# EasyEDA Pro project ESP32S3_DMX_RDM_2026-06-09.epro, schematic Schematic1
Create Date: 2026-09-02; Page Name: P1; Project Name: ESP32S3_DMX_RDM_2026-06-09; Schematic Name: Schematic1; Update Date: 2026-09-02; Company: 嘉立创EDA; Page Size: A3; Version: V1.0
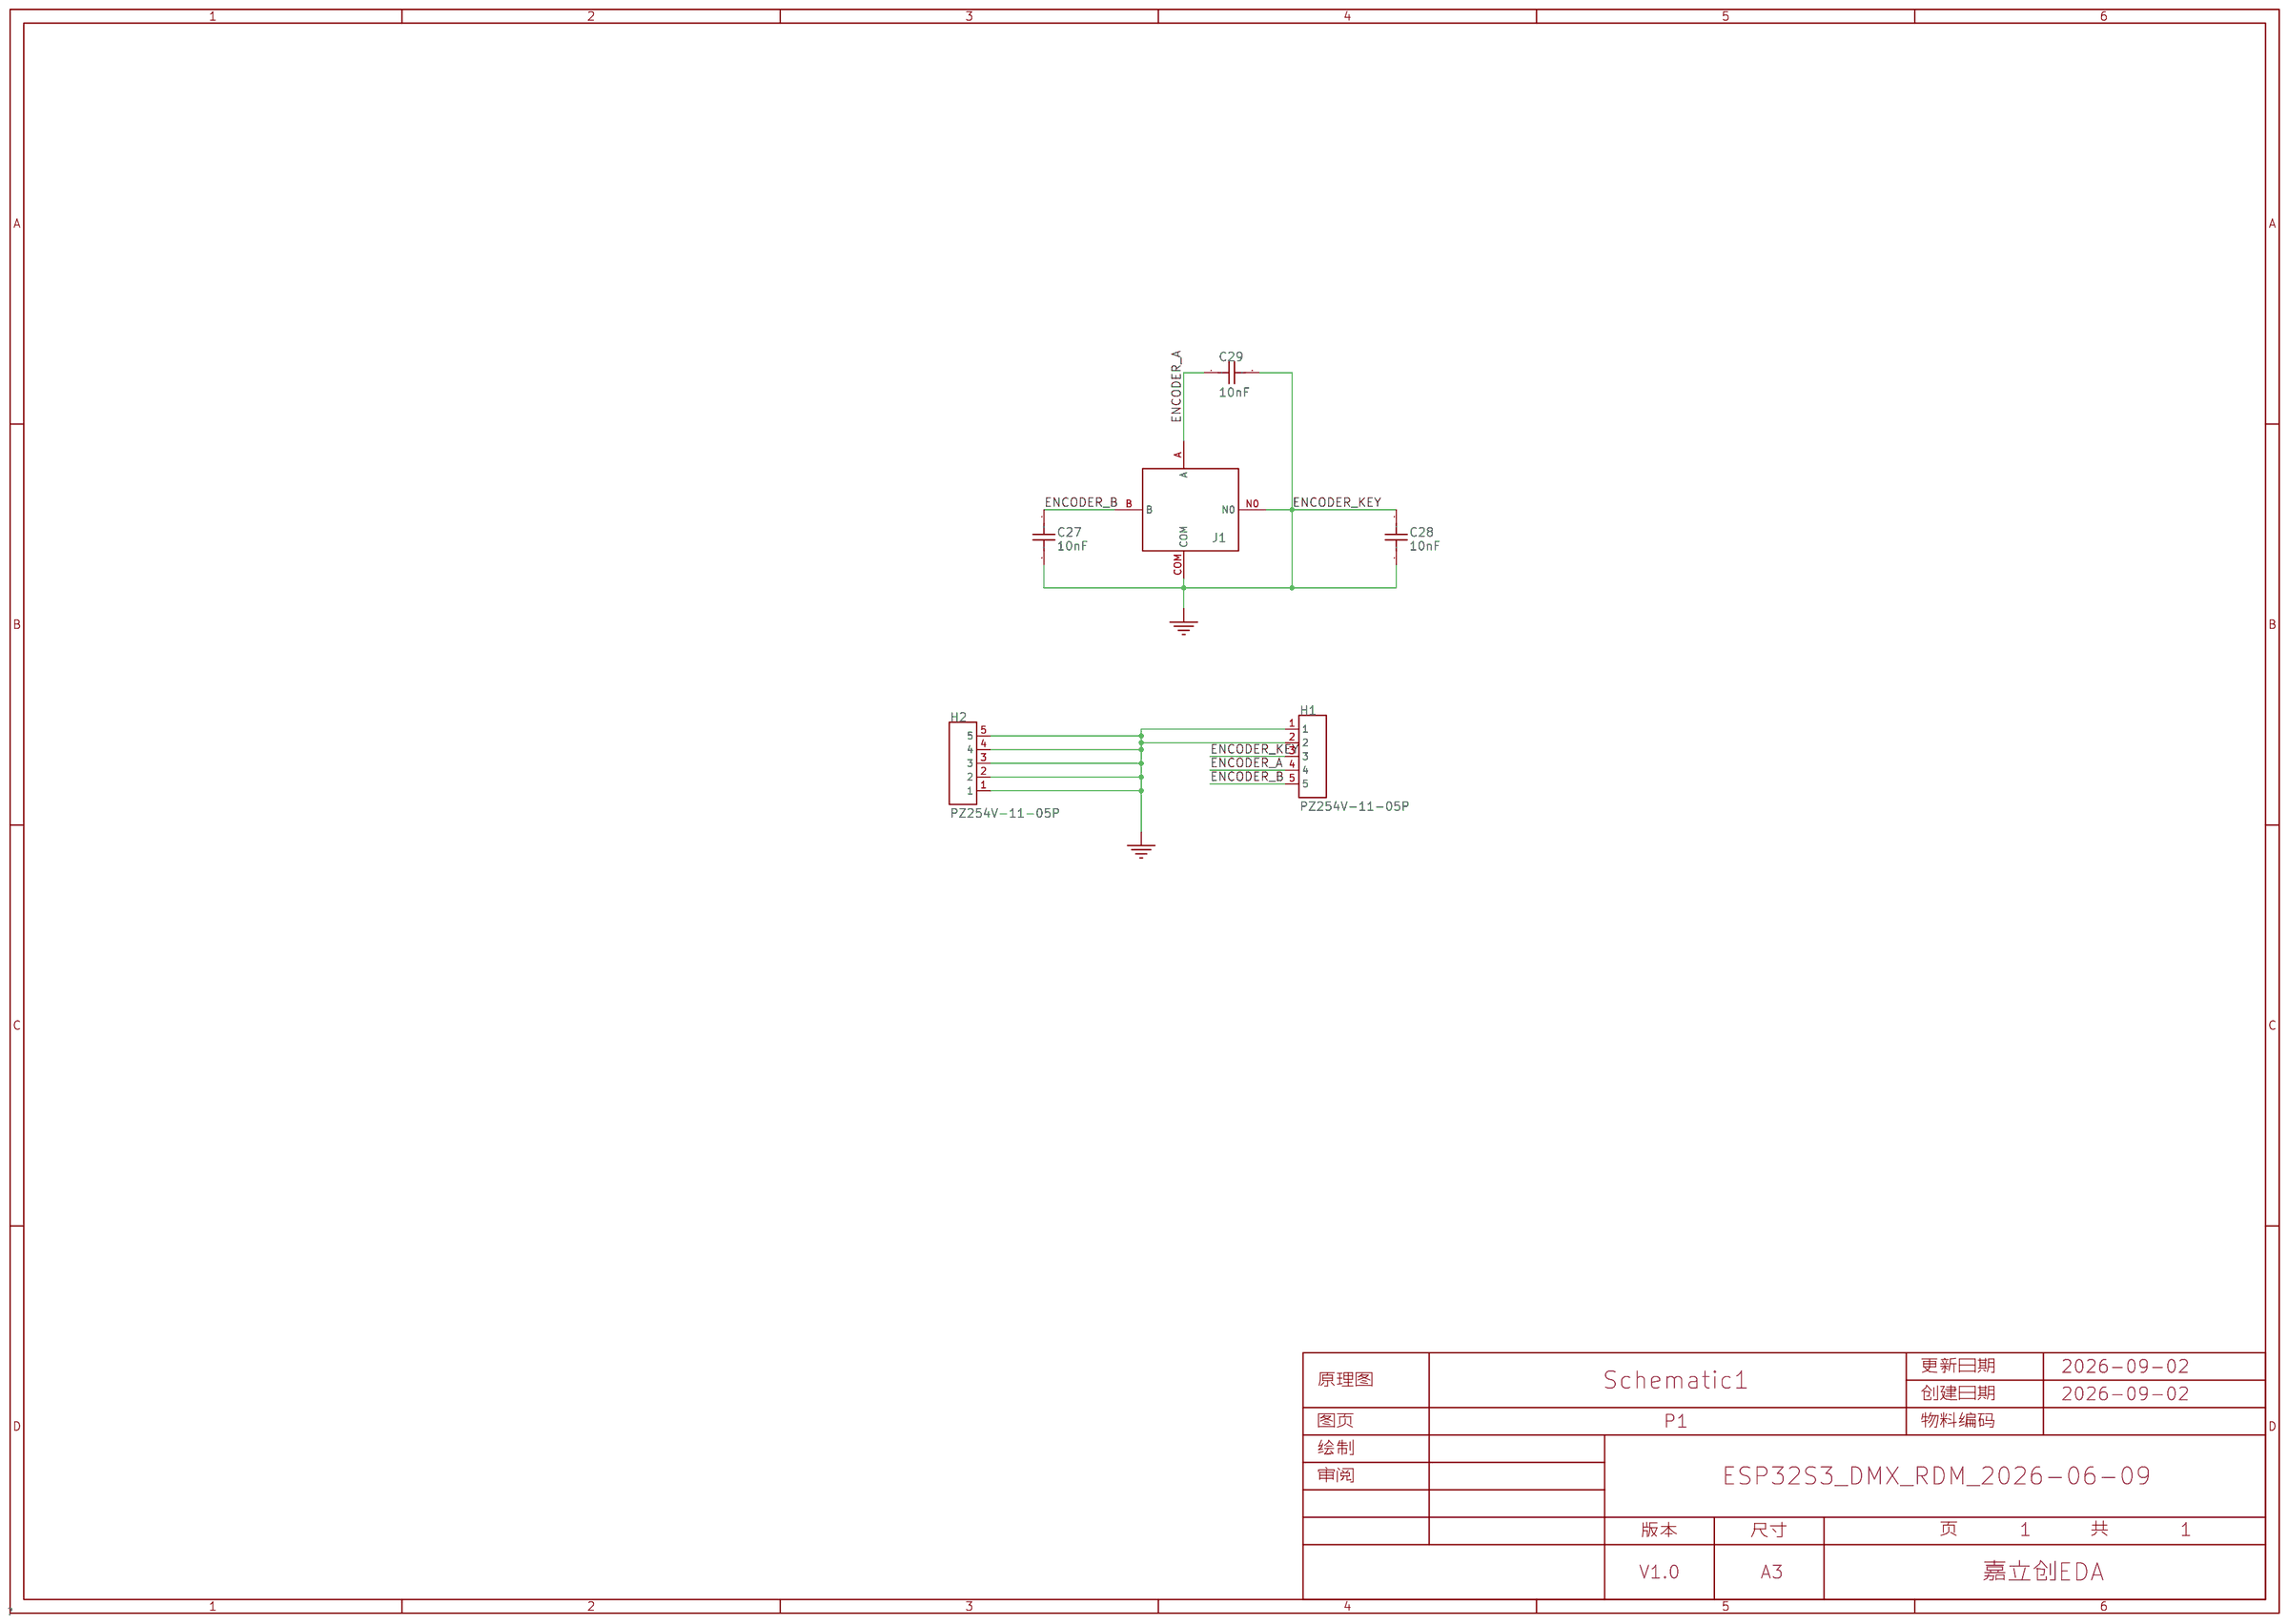
[diagram p0: schematic sheet]

## Parts
C27  10nF  [C0402]
C28  10nF  [C0402]
C29  10nF  [C0402]
H1  PZ254V-11-05P  [HDR-TH_5P-P2.54-V-M]
H2  PZ254V-11-05P  [HDR-TH_5P-P2.54-V-M]
J1  -  [AN-P1S-2SP-Z]

## Library data of the parts
C27-C29 = CC0402KRX7R7BB103: 容值:10nF;精度:±10%;额定电压:16V;温度系数:X7R;; LCSC Part Name: 10nF ±10% 16V; Supplier Part: C327009; Manufacturer: YAGEO(国巨); Supplier Footprint: 0402; JLCPCB Part Class: 扩展库; Datasheet: https://item.szlcsc.com/datasheet/CC0402KRX7R7BB103/307103.html; Supplier: LCSC; Tolerance: ±10%; Voltage Rating: 16V; Temperature Coefficient: X7R
H1 H2 = PZ254V-11-05P: 插针结构:1x5P;间距:2.54mm;行距:-;圆针/方针:方针;安装方式:直插;排数:单排;总PIN位数:5P;额定电流:-;额定电压:-;配合针长度:6mm;塑高:2.5mm;端接针长度:3mm;触头材质:黄铜;触头镀层:-;工作温度:-40℃~+105℃;颜色:黑色;; LCSC Part Name: 1x5P 间距:2.54mm 方针 直插; Supplier Part: C492404; Manufacturer: XFCN(兴飞); Supplier Footprint: 插件,P=2.54mm; JLCPCB Part Class: 扩展库; Datasheet: https://atta.szlcsc.com/upload/public/pdf/source/20200309/C492404_E51533260F8710EFF5D4617281164C1D.pdf; Supplier: LCSC; Pin Structure: 1x5P; Pitch: 2.54mm; Circluar Pins/Square Pins: 方针; Mounting Type: 直插; Number of Rows: 单排; Number of Pins: 5P; Length of Mating Pin: 6mm; Insulation Height: 2.5mm; Length of End Connection Pin: 3mm; Contact Material: 黄铜; Operating Temperature: -40℃~+105℃; Color: 黑色
J1 = AN-P1S-2SP-Z: 新巨旋钮

## Nets
GND: C27.2 C28.2 C29.2 H1.1 H1.2 H2.1 H2.2 H2.3 H2.4 H2.5 J1.COM
ENCODER_A: C29.1 H1.4 J1.A
ENCODER_B: C27.1 H1.5 J1.B
ENCODER_KEY: C28.1 H1.3 J1.N0
